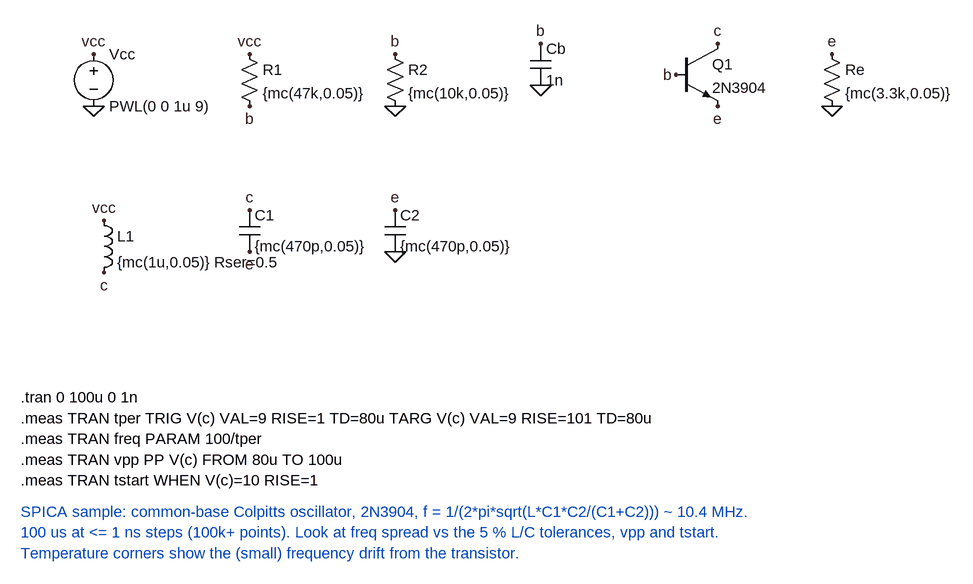
[diagram p0: schematic colpitts_osc.asc]
colpitts_osc.asc, the LTspice schematic file:
Version 4
SHEET 1 1600 1200
FLAG 144 80 vcc
FLAG 144 160 0
FLAG 384 80 vcc
FLAG 384 160 b
FLAG 608 80 b
FLAG 608 160 0
FLAG 832 64 b
FLAG 832 128 0
FLAG 1104 64 c
FLAG 1040 112 b
FLAG 1104 160 e
FLAG 1280 80 e
FLAG 1280 160 0
FLAG 160 336 vcc
FLAG 160 416 c
FLAG 384 320 c
FLAG 384 384 e
FLAG 608 320 e
FLAG 608 384 0
SYMBOL voltage 144 64 R0
SYMATTR InstName Vcc
SYMATTR Value PWL(0 0 1u 9)
SYMBOL res 368 64 R0
SYMATTR InstName R1
SYMATTR Value {mc(47k,0.05)}
SYMBOL res 592 64 R0
SYMATTR InstName R2
SYMATTR Value {mc(10k,0.05)}
SYMBOL cap 816 64 R0
SYMATTR InstName Cb
SYMATTR Value 1n
SYMBOL npn 1040 64 R0
SYMATTR InstName Q1
SYMATTR Value 2N3904
SYMBOL res 1264 64 R0
SYMATTR InstName Re
SYMATTR Value {mc(3.3k,0.05)}
SYMBOL ind 144 320 R0
SYMATTR InstName L1
SYMATTR Value {mc(1u,0.05)} Rser=0.5
SYMBOL cap 368 320 R0
SYMATTR InstName C1
SYMATTR Value {mc(470p,0.05)}
SYMBOL cap 592 320 R0
SYMATTR InstName C2
SYMATTR Value {mc(470p,0.05)}
TEXT 32 608 Left 2 !.tran 0 100u 0 1n
TEXT 32 640 Left 2 !.meas TRAN tper TRIG V(c) VAL=9 RISE=1 TD=80u TARG V(c) VAL=9 RISE=101 TD=80u
TEXT 32 672 Left 2 !.meas TRAN freq PARAM 100/tper
TEXT 32 704 Left 2 !.meas TRAN vpp PP V(c) FROM 80u TO 100u
TEXT 32 736 Left 2 !.meas TRAN tstart WHEN V(c)=10 RISE=1
TEXT 32 784 Left 2 ;SPICA sample: common-base Colpitts oscillator, 2N3904, f = 1/(2*pi*sqrt(L*C1*C2/(C1+C2))) ~ 10.4 MHz.
TEXT 32 816 Left 2 ;100 us at <= 1 ns steps (100k+ points). Look at freq spread vs the 5 % L/C tolerances, vpp and tstart.
TEXT 32 848 Left 2 ;Temperature corners show the (small) frequency drift from the transistor.

The netlist it stands for:
* colpitts_osc.asc
Vcc vcc 0 PWL(0 0 1u 9)
R1 vcc b {mc(47k,0.05)}
R2 b 0 {mc(10k,0.05)}
Cb b 0 1n
Q1 c b e 0 2N3904
Re e 0 {mc(3.3k,0.05)}
L1 vcc c {mc(1u,0.05)} Rser=0.5
C1 c e {mc(470p,0.05)}
C2 e 0 {mc(470p,0.05)}
.model NPN NPN
.model PNP PNP
.lib standard.bjt
.tran 0 100u 0 1n
.meas TRAN tper TRIG V(c) VAL=9 RISE=1 TD=80u TARG V(c) VAL=9 RISE=101 TD=80u
.meas TRAN freq PARAM 100/tper
.meas TRAN vpp PP V(c) FROM 80u TO 100u
.meas TRAN tstart WHEN V(c)=10 RISE=1
* SPICA sample: common-base Colpitts oscillator, 2N3904, f = 1/(2*pi*sqrt(L*C1*C2/(C1+C2))) ~ 10.4 MHz.
* 100 us at <= 1 ns steps (100k+ points). Look at freq spread vs the 5 % L/C tolerances, vpp and tstart.
* Temperature corners show the (small) frequency drift from the transistor.
.backanno
.end